# Altium schematic sheet [04] - KEYS.SchDoc
size A4
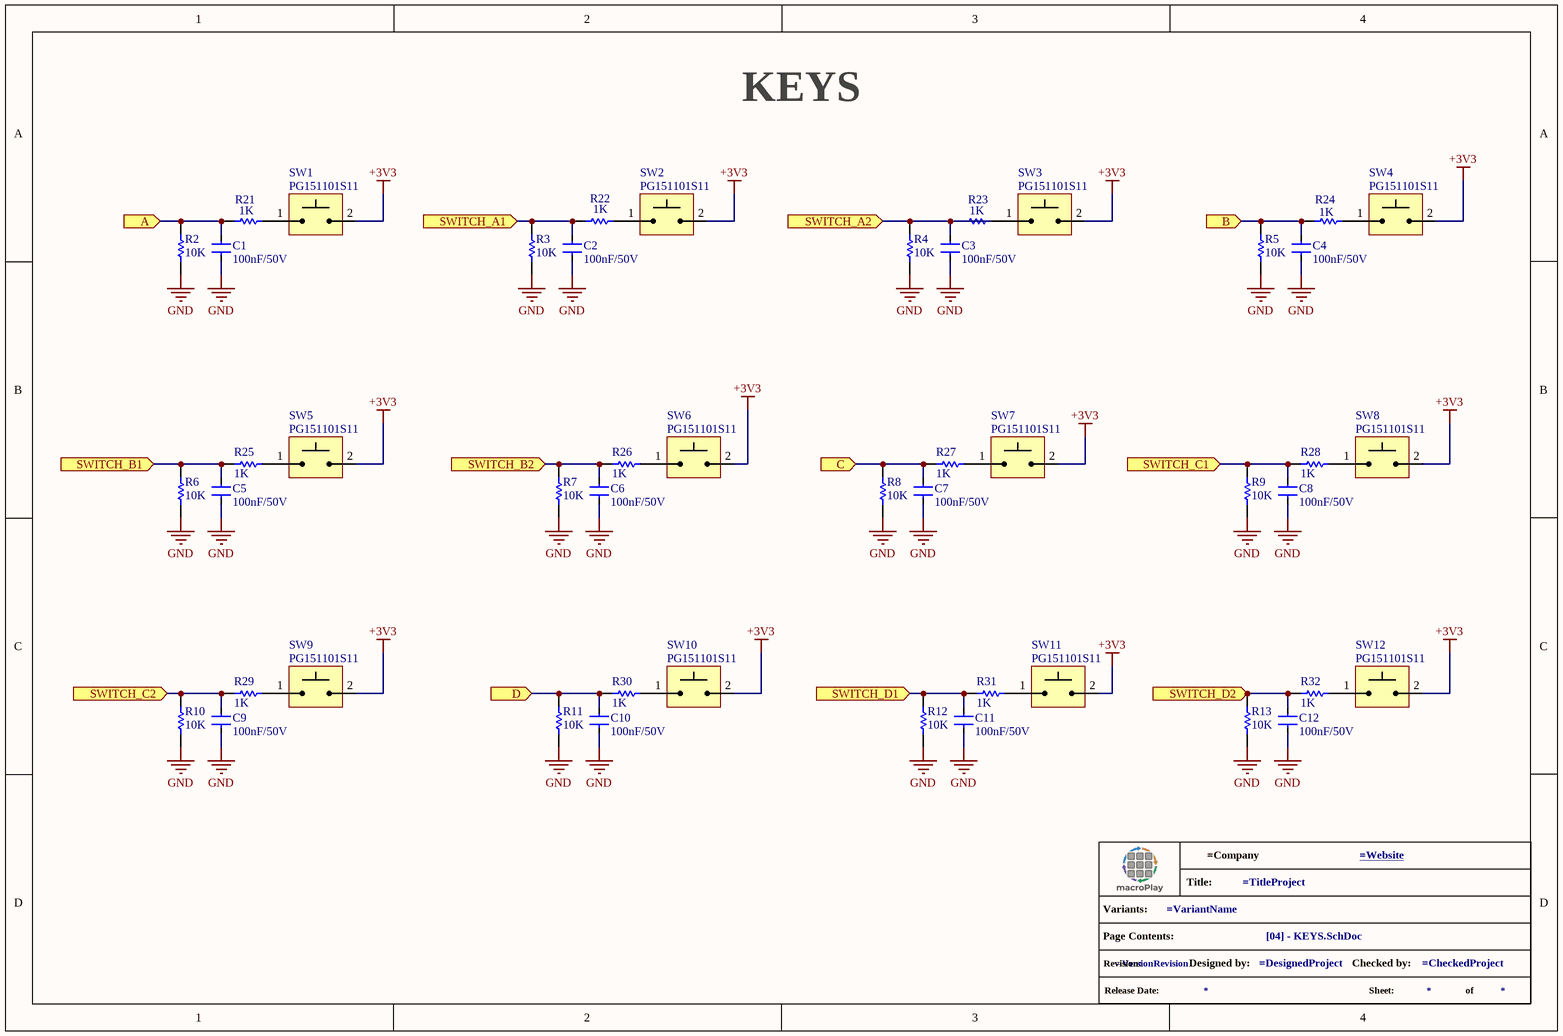
[diagram p0: [04] - KEYS.SchDoc]

## Parts
C1  100nF/50V  [C0805 - ironsoldering]
C2  100nF/50V  [C0805 - ironsoldering]
C3  100nF/50V  [C0805 - ironsoldering]
C4  100nF/50V  [C0805 - ironsoldering]
C5  100nF/50V  [C0805 - ironsoldering]
C6  100nF/50V  [C0805 - ironsoldering]
C7  100nF/50V  [C0805 - ironsoldering]
C8  100nF/50V  [C0805 - ironsoldering]
C9  100nF/50V  [C0805 - ironsoldering]
C10  100nF/50V  [C0805 - ironsoldering]
C11  100nF/50V  [C0805 - ironsoldering]
C12  100nF/50V  [C0805 - ironsoldering]
GPH?  info_project  (value not drawn)  (graphical)
R2  10K  [R0805 - ironsoldering]
R3  10K  [R0805 - ironsoldering]
R4  10K  [R0805 - ironsoldering]
R5  10K  [R0805 - ironsoldering]
R6  10K  [R0805 - ironsoldering]
R7  10K  [R0805 - ironsoldering]
R8  10K  [R0805 - ironsoldering]
R9  10K  [R0805 - ironsoldering]
R10  10K  [R0805 - ironsoldering]
R11  10K  [R0805 - ironsoldering]
R12  10K  [R0805 - ironsoldering]
R13  10K  [R0805 - ironsoldering]
R21  1K  [R0805 - ironsoldering]
R22  1K  [R0805 - ironsoldering]
R23  1K  [R0805 - ironsoldering]
R24  1K  [R0805 - ironsoldering]
R25  1K  [R0805 - ironsoldering]
R26  1K  [R0805 - ironsoldering]
R27  1K  [R0805 - ironsoldering]
R28  1K  [R0805 - ironsoldering]
R29  1K  [R0805 - ironsoldering]
R30  1K  [R0805 - ironsoldering]
R31  1K  [R0805 - ironsoldering]
R32  1K  [R0805 - ironsoldering]
SW1  PG151101S11  [SW_PG151101S11]
SW2  PG151101S11  [SW_PG151101S11]
SW3  PG151101S11  [SW_PG151101S11]
SW4  PG151101S11  [SW_PG151101S11]
SW5  PG151101S11  [SW_PG151101S11]
SW6  PG151101S11  [SW_PG151101S11]
SW7  PG151101S11  [SW_PG151101S11]
SW8  PG151101S11  [SW_PG151101S11]
SW9  PG151101S11  [SW_PG151101S11]
SW10  PG151101S11  [SW_PG151101S11]
SW11  PG151101S11  [SW_PG151101S11]
SW12  PG151101S11  [SW_PG151101S11]

## Ports
A (in), B (in), C (in), D (in), SWITCH_A1 (in), SWITCH_A2 (in), SWITCH_B1 (in), SWITCH_B2 (in), SWITCH_C1 (in), SWITCH_C2 (in), SWITCH_D1 (in), SWITCH_D2 (in)

## Nets
+3V3: SW1.2 SW2.2 SW3.2 SW4.2 SW5.2 SW6.2 SW7.2 SW8.2 SW9.2 SW10.2 SW11.2 SW12.2
GND: C1.1 C2.1 C3.1 C4.1 C5.1 C6.1 C7.1 C8.1 C9.1 C10.1 C11.1 C12.1 R2.1 R3.1 R4.2 R5.2 R6.2 R7.1 R8.1 R9.1 R10.2 R11.2 R12.2 R13.2
A: C1.2 R2.2 R21.1 ; port A
B: C4.2 R5.1 R24.1 ; port B
C: C7.2 R8.2 R27.1 ; port C
D: C10.2 R11.1 R30.1 ; port D
SWITCH_A1: C2.2 R3.2 R22.1 ; port SWITCH_A1
SWITCH_A2: C3.2 R4.1 R23.1 ; port SWITCH_A2
SWITCH_B1: C5.2 R6.1 R25.1 ; port SWITCH_B1
SWITCH_B2: C6.2 R7.2 R26.1 ; port SWITCH_B2
SWITCH_C1: C8.2 R9.2 R28.1 ; port SWITCH_C1
SWITCH_C2: C9.2 R10.1 R29.1 ; port SWITCH_C2
SWITCH_D1: C11.2 R12.1 R31.1 ; port SWITCH_D1
SWITCH_D2: C12.2 R13.1 R32.1 ; port SWITCH_D2
NetR21_2: R21.2 SW1.1
NetR22_2: R22.2 SW2.1
NetR23_2: R23.2 SW3.1
NetR24_2: R24.2 SW4.1
NetR25_2: R25.2 SW5.1
NetR26_2: R26.2 SW6.1
NetR27_2: R27.2 SW7.1
NetR28_2: R28.2 SW8.1
NetR29_2: R29.2 SW9.1
NetR30_2: R30.2 SW10.1
NetR31_2: R31.2 SW11.1
NetR32_2: R32.2 SW12.1

## Notes on the sheet
- KEYS
- (in symbol info_project) Title:; Variants:; Page Contents:; Revision:; Designed by:; Checked by:; Release Date:; Sheet:; of

## Library data of the parts
C1-C12 = CL21B104KBCNNNC: MLCC - 100nF 50V X7R 0805 ±10%; Manufacturer: Samsung Electro-Mechanics; Dielectric Material: Ceramic; .Mounting: SMD; Supplier: Future Electronics; Supplier Part Number: CL21B104KBCNNNC; Manufacturer Part Number: CL21B104KBCNNNC; RoHS: Compliant; Category: Ceramic Capacitors; Stock: 6136000; Pricing: 4000=0,0059, 16000=0,0057, 60000=0,0055, 100000=0,0054, 200000=0,0052 (USD); Value: 100nF; Case/Package: 0805; Case Code (Imperial): 0805; Case Code (Metric): 2012; China RoHS: Compliant; Contact Plating: Tin; Country of Origin: Mainland China, Philippines, South Korea; Depth: 1.25mm; Dielectric: X7R; Export Control Classification Number (ECCN) Code: EAR99; Height: 950µm; Harmonized Tariff Schedule (HTS) Code: 8532.24.00.20; Introduction Date: 2009-07-27; Lead Free: Lead Free; Length: 2mm; Lifecycle Status: Production; Material: Ceramic; Max Operating Temperature: 125°C; Min Operating Temperature: -55°C; Mounting Technology: Surface Mount; Number of Terminals: 2; Radiation Hardening: No; REACH SVHC: Yes; Schedule B: 8532240020, 8532240020|8532240020, 8532240020|8532240020|8532240020, 8532240020|8532240020|8532240020|8532240020; Thickness: 939.8µm; Tolerance: 10%; Voltage: 50V; Voltage Rating: 50V; Voltage Rating (DC): 50V; Width: 1.25mm; ComponentLink1URL: https://datasheet.octopart.com:443/CL21B104KBCNNNC-Samsung-Electro-Mechanics-datasheet-137745078.pdf?src-supplier=IHS; ComponentLink1Description: https://datasheet.octopart.com:443/CL21B104KBCNNNC-Samsung-Electro-Mechanics-datasheet-137745078.pdf?src-supplier=IHS; ComponentLink2URL: https://datasheet.octopart.com/CL21B104KBCNNNC-Samsung-Electro-Mechanics-datasheet-8324245.pdf; ComponentLink2Description: https://datasheet.octopart.com/CL21B104KBCNNNC-Samsung-Electro-Mechanics-datasheet-8324245.pdf; ComponentLink3URL: https://datasheet.octopart.com/CL21B104KBCNNNC-Samsung-Electro-Mechanics-datasheet-97040617.pdf; ComponentLink3Description: https://datasheet.octopart.com/CL21B104KBCNNNC-Samsung-Electro-Mechanics-datasheet-97040617.pdf; ComponentLink4URL: https://datasheet.octopart.com/General-Multilayer-Ceramic-Capacitors-Samsung-datasheet-family-111.pdf; ComponentLink4Description: https://datasheet.octopart.com/General-Multilayer-Ceramic-Capacitors-Samsung-datasheet-family-111.pdf; ComponentLink5URL: https://datasheet.octopart.com:443/CL21B104KBCNNNC-Samsung-Electro-Mechanics-datasheet-11548950.pdf?src-supplier=Future+Electronics; ComponentLink5Description: https://datasheet.octopart.com:443/CL21B104KBCNNNC-Samsung-Electro-Mechanics-datasheet-11548950.pdf?src-supplier=Future+Electronics; ComponentLink6URL: https://datasheet.octopart.com:443/CL21B104KBCNNNC-Samsung-Electro-Mechanics-datasheet-116891032.pdf?src-supplier=Future+Electronics; ComponentLink6Description: https://datasheet.octopart.com:443/CL21B104KBCNNNC-Samsung-Electro-Mechanics-datasheet-116891032.pdf?src-supplier=Future+Electronics; ComponentLink7URL: https://datasheet.octopart.com:443/CL21B104KBCNNNC-Samsung-Electro-Mechanics-datasheet-81462175.pdf?src-supplier=Future+Electronics; ComponentLink7Description: https://datasheet.octopart.com:443/CL21B104KBCNNNC-Samsung-Electro-Mechanics-datasheet-81462175.pdf?src-supplier=Future+Electronics; ComponentLink8URL: https://datasheet.octopart.com:443/CL21B104KBCNNNC-Samsung-datasheet-42485244.pdf?src-supplier=Future+Electronics; ComponentLink8Description: https://datasheet.octopart.com:443/CL21B104KBCNNNC-Samsung-datasheet-42485244.pdf?src-supplier=Future+Electronics; ComponentLink9URL: https://datasheet.octopart.com:443/CL21B104KBCNNNC-Samsung-Electro-Mechanics-datasheet-149045937.pdf?src-supplier=Future+Electronics; ComponentLink9Description: https://datasheet.octopart.com:443/CL21B104KBCNNNC-Samsung-Electro-Mechanics-datasheet-149045937.pdf?src-supplier=Future+Electronics; ComponentLink10URL: https://datasheet.octopart.com:443/CL21B104KBCNNNC-Samsung-datasheet-8326407.pdf?src-supplier=TME; ComponentLink10Description: https://datasheet.octopart.com:443/CL21B104KBCNNNC-Samsung-datasheet-8326407.pdf?src-supplier=TME; ComponentLink11URL: http://sigma.octopart.com:80/rohs_certificate/General-Multilayer-Ceramic-Capacitors-Samsung-family-110.pdf?src-supplier=Compliance+Statements; ComponentLink11Description: http://sigma.octopart.com:80/rohs_certificate/General-Multilayer-Ceramic-Capacitors-Samsung-family-110.pdf?src-supplier=Compliance+Statements; ComponentLink12URL: http://sigma.octopart.com:80/rohs_statement/General-Multilayer-Ceramic-Capacitors-Samsung-family-132.pdf?src-supplier=Compliance+Statements; ComponentLink12Description: http://sigma.octopart.com:80/rohs_statement/General-Multilayer-Ceramic-Capacitors-Samsung-family-132.pdf?src-supplier=Compliance+Statements; ComponentLink13URL: http://sigma.octopart.com:80/reach_statement/General-Multilayer-Ceramic-Capacitors-Samsung-family-133.pdf?src-supplier=Compliance+Statements; ComponentLink13Description: http://sigma.octopart.com:80/reach_statement/General-Multilayer-Ceramic-Capacitors-Samsung-family-133.pdf?src-supplier=Compliance+Statements; .SCHChecked: *; .PCBChecked: *
GPH? = info_project: GRAPHICAL - Info Project
R2-R13 = RMCF0805FT10K0: RES - 10K 1/16W 0805 ±1% Chip Resistor; Manufacturer: Stackpole Electronics; Manufacturer Package Identifier: 0805 (2012 metric); Max Power Dissipation: 125mW; Value: 10kΩ; Temperature Coefficient: 100ppm/°C; Voltage Rating: 150V; .Mounting: SMD; Supplier: Future Electronics; Supplier Part Number: RMCF0805FT10K0; Manufacturer Part Number: RMCF0805FT10K0; RoHS: Compliant; Category: Chip SMD Resistors; Stock: 3170000; Pricing: 10000=0,0027, 25000=0,0027, 100000=0,0026, 150000=0,0025, 375000=0,0024 (USD); Case/Package: 0805; Case Code (Imperial): 0805; Case Code (Metric): 2012; China RoHS: Non-Compliant; Composition: Thick Film; Contact Plating: Tin; Depth: 1.25mm; Features: Automotive AEC-Q200; Height: 500µm; Lead Free: Lead Free; Length: 2mm; Lifecycle Status: Production; Max Operating Temperature: 155°C; Military Standard: Not; Min Operating Temperature: -55°C; Mounting Technology: Surface Mount; Number of Terminals: 2; Number of Terminations: 2; Packaging: Cut Tape (CT); Power Rating: 125mW; Radiation Hardening: No; Ratings: AEC-Q200; REACH SVHC: Yes; Schedule B: 8533210045, 8533210045|8533210045, 8533210045|8533210045|8533210045, 8533210045|8533210045|8533210045|8533210045; Tolerance: 1%; Width: 1.25mm; Working Voltage: 150V; ComponentLink1URL: https://datasheet.octopart.com:443/RMCF0805FT10K0-Stackpole-Electronics-datasheet-182148065.pdf?src-supplier=IHS; ComponentLink1Description: https://datasheet.octopart.com:443/RMCF0805FT10K0-Stackpole-Electronics-datasheet-182148065.pdf?src-supplier=IHS; ComponentLink2URL: https://datasheet.octopart.com:443/RMCF0805FT10K0-Stackpole-Electronics-datasheet-12534581.pdf?src-supplier=Upverter; ComponentLink2Description: https://datasheet.octopart.com:443/RMCF0805FT10K0-Stackpole-Electronics-datasheet-12534581.pdf?src-supplier=Upverter; ComponentLink3URL: https://datasheet.octopart.com:443/RMCF0805FT10K0-Stackpole-Electronics-datasheet-12510902.pdf?src-supplier=Upverter; ComponentLink3Description: https://datasheet.octopart.com:443/RMCF0805FT10K0-Stackpole-Electronics-datasheet-12510902.pdf?src-supplier=Upverter; ComponentLink4URL: https://datasheet.octopart.com:443/RMCF0805FT10K0-Stackpole-Electronics-datasheet-28504820.pdf?src-supplier=Master+Electronics; ComponentLink4Description: https://datasheet.octopart.com:443/RMCF0805FT10K0-Stackpole-Electronics-datasheet-28504820.pdf?src-supplier=Master+Electronics; ComponentLink5URL: https://datasheet.octopart.com:443/RMCF0805FT10K0-Stackpole-Electronics-datasheet-141193804.pdf?src-supplier=Stackpole+Electronics; ComponentLink5Description: https://datasheet.octopart.com:443/RMCF0805FT10K0-Stackpole-Electronics-datasheet-141193804.pdf?src-supplier=Stackpole+Electronics; ComponentLink6URL: https://datasheet.octopart.com:443/RMCF0805FT10K0-Stackpole-Electronics-datasheet-62091608.pdf?src-supplier=Stackpole+Electronics; ComponentLink6Description: https://datasheet.octopart.com:443/RMCF0805FT10K0-Stackpole-Electronics-datasheet-62091608.pdf?src-supplier=Stackpole+Electronics; ComponentLink7URL: https://datasheet.octopart.com:443/RMCF0805FT10K0-Stackpole-Electronics-datasheet-10788263.pdf?src-supplier=Stackpole+Electronics; ComponentLink7Description: https://datasheet.octopart.com:443/RMCF0805FT10K0-Stackpole-Electronics-datasheet-10788263.pdf?src-supplier=Stackpole+Electronics; ComponentLink8URL: https://datasheet.octopart.com:443/RMCF0805FT10K0-Stackpole-Electronics-datasheet-154799224.pdf?src-supplier=JRH+Electronics; ComponentLink8Description: https://datasheet.octopart.com:443/RMCF0805FT10K0-Stackpole-Electronics-datasheet-154799224.pdf?src-supplier=JRH+Electronics; ComponentLink9URL: https://datasheet.octopart.com:443/RMCF0805FT10K0-Stackpole-Electronics-datasheet-11546843.pdf?src-supplier=Arrow+Electronics; ComponentLink9Description: https://datasheet.octopart.com:443/RMCF0805FT10K0-Stackpole-Electronics-datasheet-11546843.pdf?src-supplier=Arrow+Electronics; ComponentLink10URL: https://datasheet.octopart.com:443/RMCF0805FT10K0-Stackpole-Electronics-datasheet-11547379.pdf?src-supplier=Future+Electronics; ComponentLink10Description: https://datasheet.octopart.com:443/RMCF0805FT10K0-Stackpole-Electronics-datasheet-11547379.pdf?src-supplier=Future+Electronics; ComponentLink11URL: https://datasheet.octopart.com:443/RMCF0805FT10K0-Stackpole-Electronics-datasheet-8359789.pdf?src-supplier=Future+Electronics; ComponentLink11Description: https://datasheet.octopart.com:443/RMCF0805FT10K0-Stackpole-Electronics-datasheet-8359789.pdf?src-supplier=Future+Electronics; ComponentLink12URL: https://datasheet.octopart.com:443/RMCF0805FT10K0-Stackpole-Electronics-datasheet-8324226.pdf?src-supplier=Future+Electronics; ComponentLink12Description: https://datasheet.octopart.com:443/RMCF0805FT10K0-Stackpole-Electronics-datasheet-8324226.pdf?src-supplier=Future+Electronics; ComponentLink13URL: https://datasheet.octopart.com:443/RMCF0805FT10K0-Stackpole-Electronics-datasheet-8088878.pdf?src-supplier=Future+Electronics; ComponentLink13Description: https://datasheet.octopart.com:443/RMCF0805FT10K0-Stackpole-Electronics-datasheet-8088878.pdf?src-supplier=Future+Electronics; ComponentLink14URL: https://datasheet.octopart.com:443/RMCF0805FT10K0-Stackpole-Electronics-datasheet-5313682.pdf?src-supplier=Future+Electronics; ComponentLink14Description: https://datasheet.octopart.com:443/RMCF0805FT10K0-Stackpole-Electronics-datasheet-5313682.pdf?src-supplier=Future+Electronics; ComponentLink15URL: http://sigma.octopart.com:80/15940719/materials_sheet/Stackpole-Electronics-RMCF0805FT10K0.pdf?src-supplier=Compliance+Statements; ComponentLink15Description: http://sigma.octopart.com:80/15940719/materials_sheet/Stackpole-Electronics-RMCF0805FT10K0.pdf?src-supplier=Compliance+Statements; ComponentLink16URL: http://sigma.octopart.com:80/141158211/reach_statement/Stackpole-Electronics-RMCF0805FT10K0.pdf?src-supplier=Compliance+Statements; ComponentLink16Description: http://sigma.octopart.com:80/141158211/reach_statement/Stackpole-Electronics-RMCF0805FT10K0.pdf?src-supplier=Compliance+Statements; ComponentLink17URL: http://sigma.octopart.com:80/141158212/rohs_statement/Stackpole-Electronics-RMCF0805FT10K0.pdf?src-supplier=Compliance+Statements; ComponentLink17Description: http://sigma.octopart.com:80/141158212/rohs_statement/Stackpole-Electronics-RMCF0805FT10K0.pdf?src-supplier=Compliance+Statements; .SCHChecked: *; .PCBChecked: *
R21-R32 = RR1220P-102-D: RES - 1K 0.1W 0805 ±0.5% Chip Resistor; Manufacturer: Susumu; Manufacturer Package Identifier: 0805 (2012 metric); Max Power Dissipation: 100mW; Value: 1kΩ; Temperature Coefficient: 25ppm/°C; Voltage Rating: 100V; .Mounting: SMD; Supplier: Future Electronics; Supplier Part Number: RR1220P-102-D; Manufacturer Part Number: RR1220P-102-D; RoHS: Compliant; Category: Chip SMD Resistors; Stock: 25000; Pricing: 5000=0,0159, 15000=0,0155, 25000=0,0153, 50000=0,0151, 100000=0,0147 (USD); Case/Package: 0805; Case Code (Imperial): 0805; Composition: Thin Film; Country of Origin: Mainland China, Japan; Depth: 1.25mm; Export Control Classification Number (ECCN) Code: EAR99; Height: 400µm; Harmonized Tariff Schedule (HTS) Code: 8533.21.00.30; Introduction Date: 2004-01-27; Lead Free: Lead Free; Length: 2mm; Lifecycle Status: NRND; Max Operating Temperature: 125°C; Min Operating Temperature: -55°C; Mounting Technology: Surface Mount; Pins: 2; Number of Terminals: 2; Number of Terminations: 2; Packaging: Cut Tape; Power Rating: 100mW; REACH SVHC: No; Termination: SMD/SMT; Tolerance: 0.5%; Voltage Rating (DC): 100V; Width: 1.25mm; Working Voltage: 100V; ComponentLink1URL: https://datasheet.octopart.com:443/RR1220P-102-D-Susumu-datasheet-159770900.pdf?src-supplier=Newark; ComponentLink1Description: https://datasheet.octopart.com:443/RR1220P-102-D-Susumu-datasheet-159770900.pdf?src-supplier=Newark; ComponentLink2URL: https://datasheet.octopart.com:443/RR1220P-102-D-Susumu-datasheet-5302462.pdf?src-supplier=Newark; ComponentLink2Description: https://datasheet.octopart.com:443/RR1220P-102-D-Susumu-datasheet-5302462.pdf?src-supplier=Newark; ComponentLink3URL: https://datasheet.octopart.com:443/RR1220P-102-D-Susumu-datasheet-722.pdf?src-supplier=Newark; ComponentLink3Description: https://datasheet.octopart.com:443/RR1220P-102-D-Susumu-datasheet-722.pdf?src-supplier=Newark; ComponentLink4URL: https://datasheet.octopart.com:443/RR1220P-102-D-Susumu-datasheet-78834971.pdf?src-supplier=Farnell; ComponentLink4Description: https://datasheet.octopart.com:443/RR1220P-102-D-Susumu-datasheet-78834971.pdf?src-supplier=Farnell; ComponentLink5URL: https://datasheet.octopart.com:443/RR1220P-102-D-Susumu-datasheet-10941792.pdf?src-supplier=element14+APAC; ComponentLink5Description: https://datasheet.octopart.com:443/RR1220P-102-D-Susumu-datasheet-10941792.pdf?src-supplier=element14+APAC; ComponentLink6URL: https://datasheet.octopart.com:443/RR1220P-102-D-Susumu-datasheet-62069792.pdf?src-supplier=Future+Electronics; ComponentLink6Description: https://datasheet.octopart.com:443/RR1220P-102-D-Susumu-datasheet-62069792.pdf?src-supplier=Future+Electronics; ComponentLink7URL: https://datasheet.octopart.com:443/RR1220P-102-D-Susumu-datasheet-11047391.pdf?src-supplier=Future+Electronics; ComponentLink7Description: https://datasheet.octopart.com:443/RR1220P-102-D-Susumu-datasheet-11047391.pdf?src-supplier=Future+Electronics; ComponentLink8URL: https://datasheet.octopart.com:443/RR1220P-102-D-Susumu-datasheet-118815.pdf?src-supplier=DigiKey; ComponentLink8Description: https://datasheet.octopart.com:443/RR1220P-102-D-Susumu-datasheet-118815.pdf?src-supplier=DigiKey; .PCBChecked: *; .SCHChecked: *
SW1-SW12 = PG151101S11: SWITCH - Kailh socket for hotswap mechanical switches; .Mounting: SMD; SnapEDA_Link: https://www.snapeda.com/parts/PG151101S11/Kailh/view-part/?ref=snap; Package: Package; Value: *; MF: Kailh; MP: PG151101S11; Check_prices: https://www.snapeda.com/parts/PG151101S11/Kailh/view-part/?ref=eda; .PCBChecked: *; .SCHChecked: *